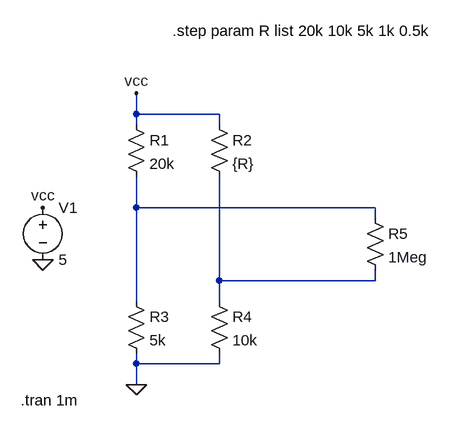
[diagram p0: schematic ntc_wien_bridge.asc]
ntc_wien_bridge.asc, the LTspice schematic file:
Version 4
SHEET 1 880 680
WIRE 32 80 32 48
WIRE 160 80 32 80
WIRE 32 96 32 80
WIRE 160 96 160 80
WIRE 32 224 32 176
WIRE 400 224 32 224
WIRE 400 240 400 224
WIRE 160 336 160 176
WIRE 400 336 400 320
WIRE 400 336 160 336
WIRE 32 368 32 224
WIRE 160 368 160 336
WIRE 32 464 32 448
WIRE 160 464 160 448
WIRE 160 464 32 464
WIRE 32 496 32 464
FLAG 32 496 0
FLAG -112 304 0
FLAG -112 224 vcc
FLAG 32 48 vcc
SYMBOL res 16 80 R0
SYMATTR InstName R1
SYMATTR Value 20k
SYMBOL res 144 80 R0
SYMATTR InstName R2
SYMATTR Value {R}
SYMBOL res 16 352 R0
SYMATTR InstName R3
SYMATTR Value 5k
SYMBOL res 144 352 R0
SYMATTR InstName R4
SYMATTR Value 10k
SYMBOL voltage -112 208 R0
WINDOW 123 0 0 Left 2
WINDOW 39 0 0 Left 2
SYMATTR InstName V1
SYMATTR Value 5
SYMBOL res 384 224 R0
SYMATTR InstName R5
SYMATTR Value 1Meg
TEXT 88 -48 Left 2 !.step param R list 20k 10k 5k 1k 0.5k
TEXT -146 520 Left 2 !.tran 1m

The netlist it stands for:
* ntc_wien_bridge.asc
R1 vcc N001 20k
R2 vcc N002 {R}
R3 N001 0 5k
R4 N002 0 10k
V1 vcc 0 5
R5 N001 N002 1Meg
.step param R list 20k 10k 5k 1k 0.5k
.tran 1m
.backanno
.end